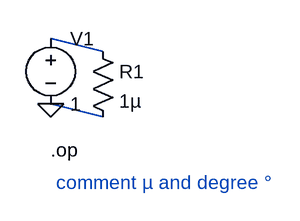
[diagram p0: schematic encoding_cp1252.asc]
encoding_cp1252.asc, the LTspice schematic file:
Version 4
SHEET 1 880 680
WIRE 160 64 96 48
WIRE 160 144 96 128
FLAG 96 128 0
SYMBOL voltage 96 32 R0
SYMATTR InstName V1
SYMATTR Value 1
SYMBOL res 144 48 R0
SYMATTR InstName R1
SYMATTR Value 1µ
TEXT 96 184 Left 2 !.op
TEXT 96 224 Left 2; comment µ and degree °

The netlist it stands for:
* encoding_cp1252.asc
V1 N001 0 1
R1 N001 0 1µ
.op
*  comment µ and degree °
.backanno
.end